# Altium schematic sheet V24Cxx(Micro)_Sh1.SchDoc: =GlobalProjectName
size 209 x 297 mm; ApprovedBy: Утвердил; CheckedBy: Проверил; Author: Разработал; SheetNumber: Лист; SheetTotal: Листов; PageSetup: Record=PageOptions|CenterHorizontal=True|CenterVertical=True|PrintScale=1.00|XCorrection=1.00|YCorrection=1.00|PrintKind=1|BorderSize=5000000|LeftOffset=0|BottomOffset=0|Orientation=2|PaperLength=1000|PaperWidth=1000|Scale=100|PaperSource=15|PrintQuality=1200|MediaType=1|DitherType=10|PaperKind=A3|PrintScaleMode=1; Weight: -; ScaleFactor: -; NormInspection: Норм.Контр.
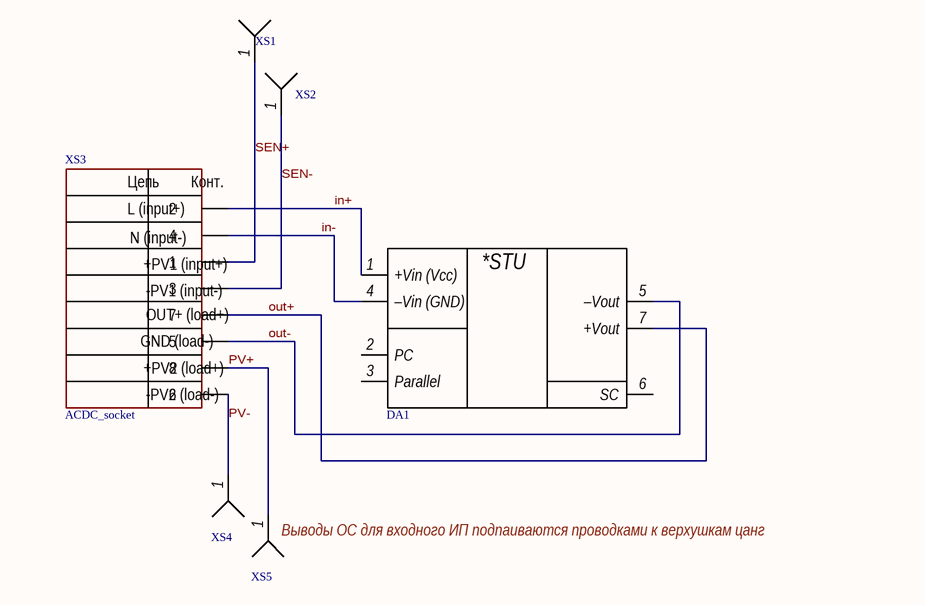
[diagram p0: V24Cxx(Micro)_Sh1.SchDoc]

## Parts
DA1  DCDC_V24Cxxx  [V24CxxxBxx]  (value not drawn)
XS1  pin  [Centr_PIN]  (value not drawn)
XS2  pin  [Centr_PIN]  (value not drawn)
XS3  ACDC_socket  [KU-DC/DC]
XS4  pin  [Centr_PIN]  (value not drawn)
XS5  pin  [Centr_PIN]  (value not drawn)

## Nets
in+: DA1.1(+Vin_(Vcc)) XS3.2
in-: DA1.4(–Vin_(GND)) XS3.4
out+: DA1.7(+Vout) XS3.7
out-: DA1.5(–Vout) XS3.5
PV+: XS3.8 XS5.1
PV-: XS3.6 XS4.1
SEN+: XS1.1 XS3.1
SEN-: XS2.1 XS3.3

Not connected (* = marked no-connect by the designer): DA1 2(PC) 3(Parallel) 6(SC)

## Notes on the sheet
- (near XS5) Выводы ОС для входного ИП подпаиваются проводками к верхушкам цанг
- Перв. примен.
- Справ. №
- Подп. и дата
- Инв. № дубл.
- Взам. инв. №
- Разраб.
- Изм.
- Лист
- № докум.
- Подп.
- Дата
- Литера
- Масса
- Масштаб
- Пров.
- Т.контр.
- Листов
- Инв. № подл.
- Н.контр.
- Утв.
- Форма 1 ГОСТ 2.104-2006
- Копировал
- Формат А4
- (in symbol ACDC_socket) Цепь; Конт.; L (input+); N (input-); +PV1 (input+); -PV1 (input-); OUT+ (load+); GND (load-); +PV2 (load+); -PV2 (load-)
- (in symbol DCDC_V24Cxxx) *STU

## Library data of the parts
XS1 XS2 XS4 XS5 = CP_1